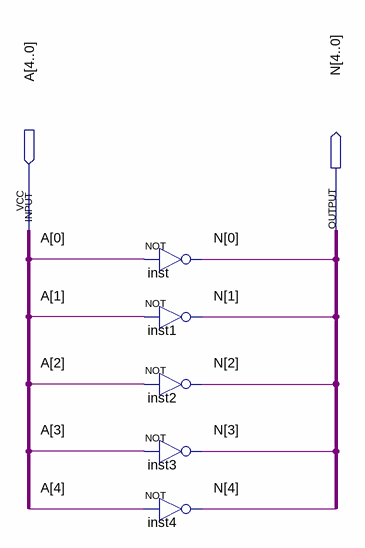
[diagram p0: schematic sheet]
// Quartus schematic not_5bits.bdf as structural Verilog: 5 symbols, 2 pins
module not_5bits (
  input  [4:0] A,
  output [4:0] N
);

  not inst (N[0], A[0]);
  not inst1 (N[1], A[1]);
  not inst2 (N[2], A[2]);
  not inst3 (N[3], A[3]);
  not inst4 (N[4], A[4]);
endmodule
